# EAGLE board kicker (EAGLE 9.1.3)
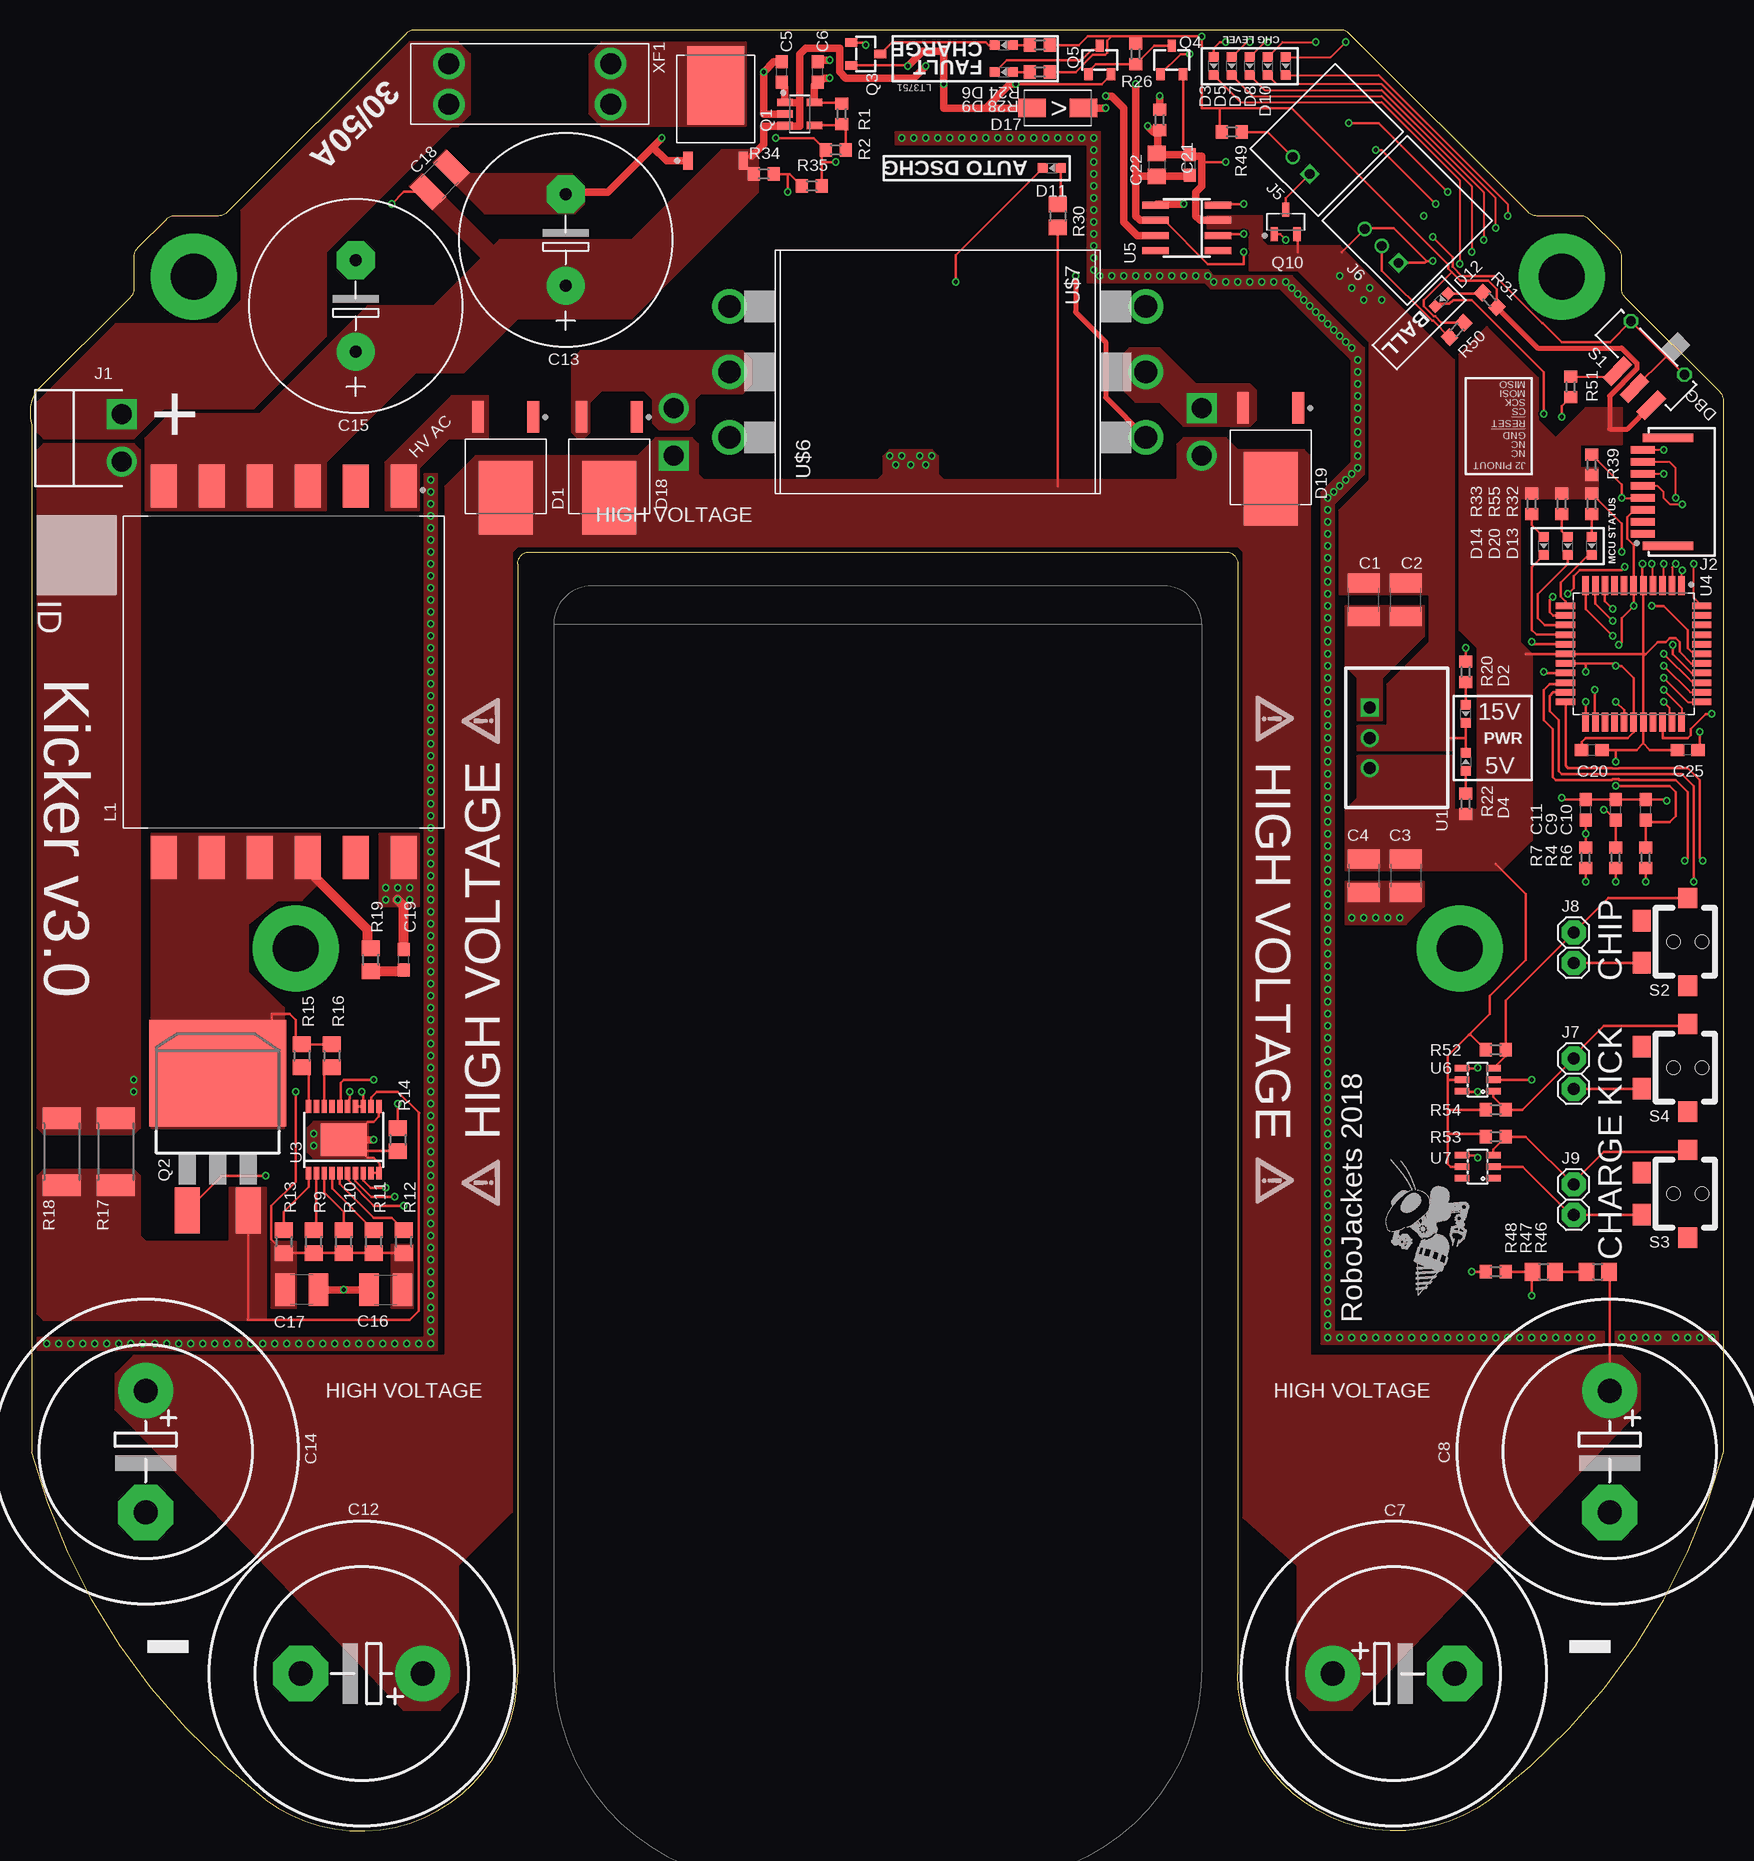
[diagram p7: board, top side]
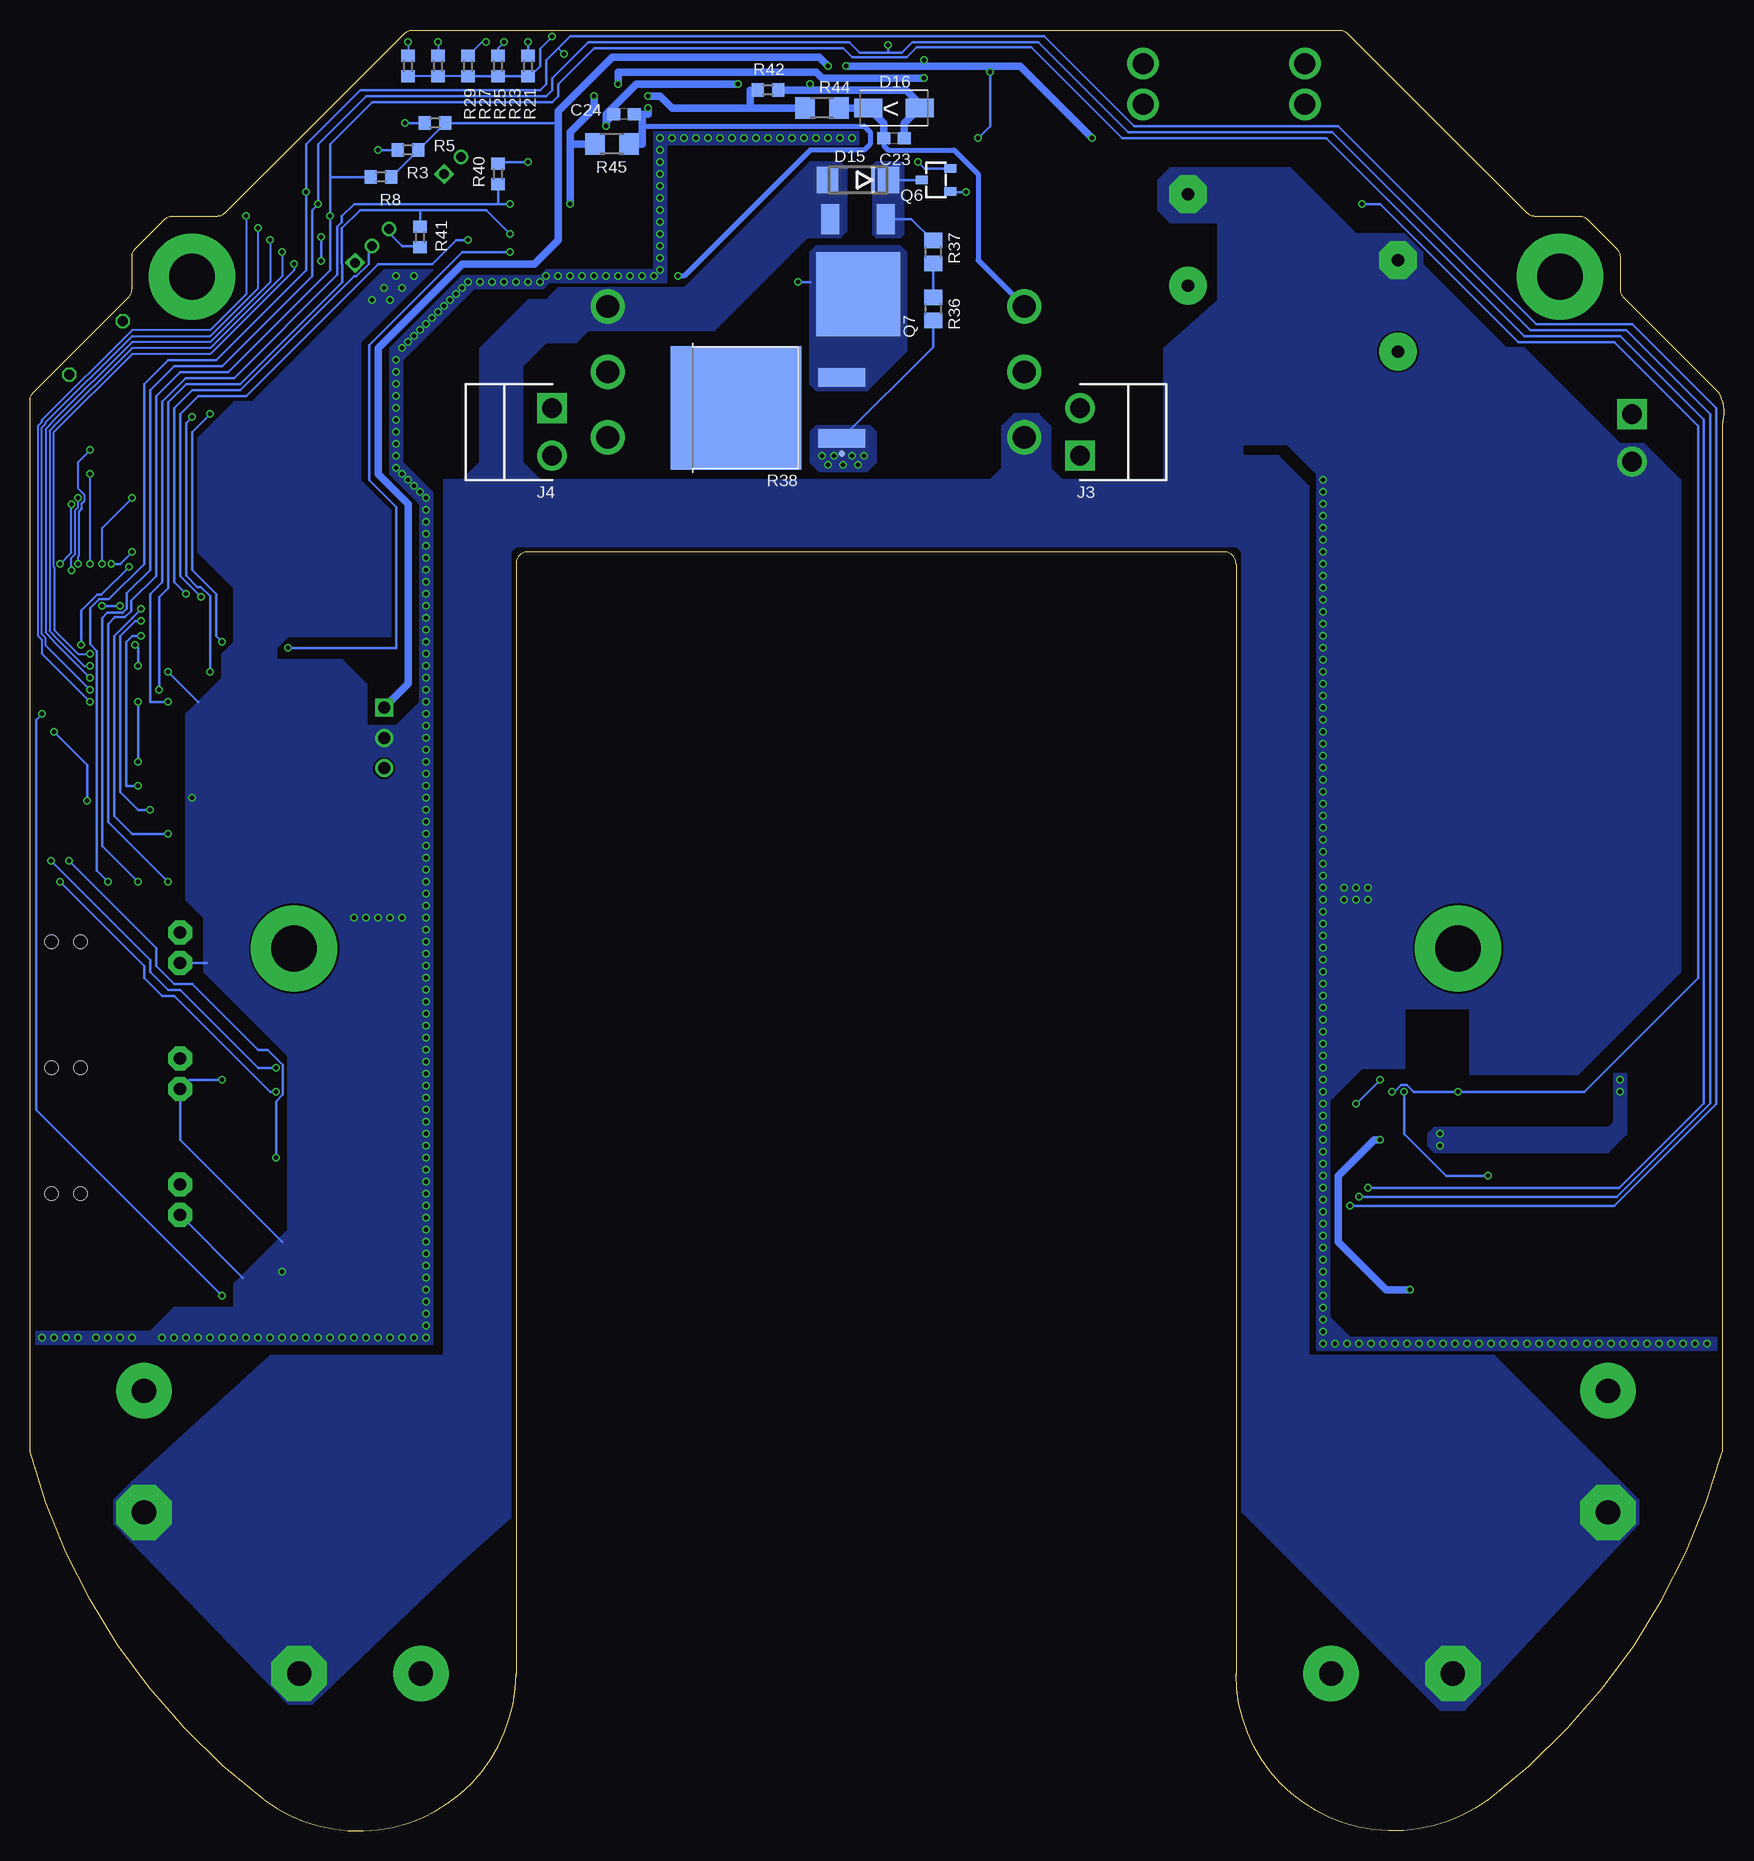
[diagram p8: board, bottom side, seen from below]

Size 141.14 x 150.12 mm. Coordinates in mm from the lower left corner, seen from the top.
Outline: 40.64,105.62 arc-90 41.64,106.62 99.64,106.62 arc-90 100.64,105.62 100.64,13.12 arc127 121.64,2.62 arc38 141.14,31.62 141.14,119.2 arc45 140.85,119.91 132.94,127.83 arc-45 132.64,128.53 132.64,131.2 arc45 132.35,131.91 129.94,134.33 arc45 129.23,134.62 125.56,134.62 arc-45 124.85,134.91 109.94,149.83 arc45 109.23,150.12 32.06,150.12 arc45 31.35,149.83 16.44,134.91 arc-45 15.73,134.62 12.06,134.62 arc45 11.35,134.33 8.94,131.91 arc45 8.64,131.2 8.64,128.53 arc-45 8.35,127.83 0.44,119.91 arc45 0.14,117.2 0.14,31.62 arc38 19.64,2.62 arc127 40.64,13.12 40.64,105.62
Copper layers (1*16): Top 0.018mm / dielectric 1.55mm / Bottom 0.018mm
Design rules "eC_2Layer_PClass6_BaseCopperO18_eCDefault": minimum track width 0.15mm, minimum drill 0.35mm, track to track 0.15mm, track to pad 0.15mm, pad to pad 0.15mm, via to via 0.15mm, smd to smd 0mil, copper to edge 0.25mm, drill to drill 0.35mm, minimum pad ring 0.175mm, minimum via ring 0.125mm, stop-mask expansion 0mil, vias tented up to drill 0.45mm, thermal gap 0.2mm
vRestrict: area 18.4,69.8 to 25.9,77.3; area 115.4,69.8 to 122.9,77.3; area 9.9,125.8 to 17.4,133.3; area 123.9,125.8 to 131.4,133.3

## Footprints (pad centres in the part's own frame; a part is rotated, then mirrored left to right if it is on the bottom)
C1210 = smd 1.6 x 2.7: 1 -1.4,0; 2 1.4,0
C0603 = smd 1.1 x 1: 1 -0.85,0; 2 0.85,0
EB25D = drill 2.007 pad 4.597: + -5.08,0 | drill 2.007 pad 4.597 octagon: - 5.08,0
E7,5-18 = drill 1.016 pad 3.15: + -3.81,0 | drill 1.016 pad 3.15 octagon: - 3.81,0
C0805 = smd 1.3 x 1.5: 1 -0.95,0; 2 0.95,0
TO460P990X239-3 = smd 2.634 x 0.974: 1 -4.241,2.3; 2 -4.241,-2.3 | smd 6.101 x 4.492: 3 2.507,0
CHIP-LED0603 = smd 0.8 x 0.8: A 0,-0.75; C 0,0.75
DO214AA = smd 1.8 x 2.2: A 2.55,0; C -2.55,0
RESM5226X262 = smd 2.316 x 1.565: 1 -2.141,0; 2 2.141,0
B2PS-CENTERED = drill 1.65 square: 1 -1.98,0 | drill 1.65: 2 1.98,0
HFW8R-1ST = smd 0.6 x 2: 1 -3.5,3.25; 2 -2.5,3.25; 3 -1.5,3.25; 4 -0.5,3.25; 5 0.5,3.25; 6 1.5,3.25; 7 2.5,3.25; 8 3.5,3.25 | smd 0.7 x 4.2: LEG1 -4.5,1.15; LEG2 4.5,1.15
2MM-2-H = drill 0.8 square: 1 0,0 | drill 0.8: 2 2,0
2MM-3-H = drill 0.8 square: 1 -2,0 | drill 0.8: 2 0,0; 3 2,0
1X2 = drill 1.016 pad 2 octagon: 1 -1.27,0; 2 1.27,0
SOP400P3370X1400-12 = smd 3.562 x 2.172: 1 -15.475,10; 2 -15.475,6; 3 -15.475,2; 4 -15.475,-2; 5 -15.475,-6; 6 -15.475,-10; 7 15.475,-10; 8 15.475,-6; 9 15.475,-2; 10 15.475,2; 11 15.475,6; 12 15.475,10
TO460P950X150-3 = smd 1.512 x 0.772: 1 -4.4,2.3; 2 -4.4,-2.3 | smd 6.542 x 4.772: 3 1.885,0
D2PAK = smd 2.083 x 3.81: 1 -2.54,-8.89; 3 2.54,-8.89 | smd 11.43 x 8.89: 2 0,2.54
SOT-23-3 = smd 0.7 x 1: 1 -0.95,-1.2; 2 0.95,-1.2; 3 0,1.2
DPAK = smd 1.5 x 2.5: 1 -2.3,-6.25; 3 2.3,-6.25 | smd 7 x 7: FIN 0,0
SOT95P240X110-3 = smd 1.18 x 0.609: 1 -1.024,0.95; 2 -1.024,-0.95; 3 1.024,0
R0603 = smd 1 x 1.1: 1 -0.85,0; 2 0.85,0
R0805 = smd 1.3 x 1.5: 1 -0.95,0; 2 0.95,0
R2512 = smd 1.8 x 3.2: 1 -2.8,0; 2 2.8,0
TO508P1539X450-3 = smd 3.912 x 1.572: 1 -6.145,2.54; 2 -6.145,-2.54 | smd 10.892 x 10.272: 3 2.655,0
R1206 = smd 1.6 x 1.803: 1 -1.422,0; 2 1.422,0
CSS-121XB = smd 1 x 2.5: 1 -3,3.75; 2 -1,3.75; 3 1,3.75 | drill 0.8 pad 1.2 octagon: LEG1 -3.15,0; LEG4 3.15,0
HDP001R = smd 1.8 x 1.5: A -1.75,-3.85; B 1.75,-3.85 | smd 1.7 x 1.6: C -3.65,0; D 3.65,0 | hole 1.1: 0,1.2; 0,-1.2
R-78E = drill 1 square: 1 -2.54,0 | drill 1: 2 0,0; 3 2.54,0
SOT95P280X145-5 = smd 1.259 x 0.609: 1 -1.228,0.95; 2 -1.228,0; 3 -1.228,-0.95; 4 1.228,-0.95; 5 1.228,0.95
TSSOP-20_EP = smd 1.05 x 0.45: 1 -2.775,2.925; 2 -2.775,2.275; 3 -2.775,1.625; 4 -2.775,0.975; 5 -2.775,0.325; 6 -2.775,-0.325; 7 -2.775,-0.975; 8 -2.775,-1.625; 9 -2.775,-2.275; 10 -2.775,-2.925; 11 2.775,-2.925; 12 2.775,-2.275; 13 2.775,-1.625; 14 2.775,-0.975; 15 2.775,-0.325; 16 2.775,0.325; 17 2.775,0.975; 18 2.775,1.625; 19 2.775,2.275; 20 2.775,2.925 | smd 2.74 x 3.86: PAD 0,0
QFP80P1200X1200X120-44 = smd 1.6 x 0.547: 1 -5.681,4; 2 -5.681,3.2; 3 -5.681,2.4; 4 -5.681,1.6; 5 -5.681,0.8; 6 -5.681,0; 7 -5.681,-0.8; 8 -5.681,-1.6; 9 -5.681,-2.4; 10 -5.681,-3.2; 11 -5.681,-4; 23 5.681,-4; 24 5.681,-3.2; 25 5.681,-2.4; 26 5.681,-1.6; 27 5.681,-0.8; 28 5.681,0; 29 5.681,0.8; 30 5.681,1.6; 31 5.681,2.4; 32 5.681,3.2; 33 5.681,4 | smd 0.547 x 1.6: 12 -4,-5.681; 13 -3.2,-5.681; 14 -2.4,-5.681; 15 -1.6,-5.681; 16 -0.8,-5.681; 17 0,-5.681; 18 0.8,-5.681; 19 1.6,-5.681; 20 2.4,-5.681; 21 3.2,-5.681; 22 4,-5.681; 34 4,5.681; 35 3.2,5.681; 36 2.4,5.681; 37 1.6,5.681; 38 0.8,5.681; 39 0,5.681; 40 -0.8,5.681; 41 -1.6,5.681; 42 -2.4,5.681; 43 -3.2,5.681; 44 -4,5.681
SOIC-8 = smd 0.6 x 2.2: 1 -1.905,-2.6; 2 -0.635,-2.6; 3 0.635,-2.6; 4 1.905,-2.6; 5 1.905,2.6; 6 0.635,2.6; 7 -0.635,2.6; 8 -1.905,2.6
SOT-23-6 = smd 0.55 x 1.2: 1 -0.95,-1.3; 2 0,-1.3; 3 0.95,-1.3; 4 0.95,1.3; 5 0,1.3; 6 -0.95,1.3
TO264 = drill 1.905: C_BOT 0,-6.35; E_BOT 5.461,-6.35; G_BOT -5.461,-6.35
3557-2 = drill 1.75: 1 -6.735,1.7; 2 -6.735,-1.7; 3 6.735,-1.7; 4 6.735,1.7

## Placement (x,y rotation side)
C1  4.7uf 35V  [C1210]  111.14,102.62 90 top
C2  4.7uf 35V  [C1210]  114.64,102.62 90 top
C3  4.7uf 16V  [C1210]  114.64,79.62 270 top
C4  4.7uf 16V  [C1210]  111.14,79.62 270 top
C5  1uF  [C0603]  62.64,146.62 90 top
C6  2.2uF  [C0603]  65.64,146.62 90 top
C7  1000uF  [EB25D]  113.64,13.12 0 top
C8  1000uF  [EB25D]  131.64,31.62 270 top
C9  1uF  [C0603]  132.14,85.12 90 top
C10  1uF  [C0603]  134.64,85.12 90 top
C11  1uF  [C0603]  129.64,85.12 90 top
C12  1000uF  [EB25D]  27.64,13.12 180 top
C13  560uF  [E7,5-18]  44.64,132.62 90 top
C14  1000uF  [EB25D]  9.64,31.62 270 top
C15  560uF  [E7,5-18]  27.14,127.12 90 top
C16  10uF (X7R)  [C1210]  29.64,45.12 0 top
C17  10uF (X7R)  [C1210]  22.64,45.12 180 top
C18  10uF (X7R)  [C1210]  34.14,137.62 225 top
C19  220pF 100V  [C0603]  31.14,72.62 90 top
C20  0.1uF  [C0603]  130.14,90.12 0 top
C21  0.1uF 35V  [C0603]  96.64,138.87 270 top
C22  22uF 35V  [C0805]  93.89,138.87 270 top
C23  0.1uF 50V  [C0603]  69.14,141.12 0 bottom
C24  0.1uF 50V  [C0603]  91.64,143.12 180 bottom
C25  0.1uF  [C0603]  138.14,90.12 180 top
D1  VS-5EWH06FN-M3D-PAK_TO252AA  [TO460P990X239-3]  39.64,113.62 270 top
D2  GREEN  [CHIP-LED0603]  119.64,93.12 180 top
D3  GREEN  [CHIP-LED0603]  98.64,147.12 180 top
D4  GREEN  [CHIP-LED0603]  119.64,89.12 0 top
D5  GREEN  [CHIP-LED0603]  100.14,147.12 180 top
D6  GREEN  [CHIP-LED0603]  81.14,148.87 90 top
D7  YELLOW  [CHIP-LED0603]  101.64,147.12 180 top
D8  RED  [CHIP-LED0603]  103.14,147.12 180 top
D9  RED  [CHIP-LED0603]  81.14,146.62 90 top
D10  RED  [CHIP-LED0603]  104.64,147.12 180 top
D11  YELLOW  [CHIP-LED0603]  85.14,138.62 90 top
D12  BLUE  [CHIP-LED0603]  117.64,127.62 135 top
D13  GREEN  [CHIP-LED0603]  130.14,107.12 180 top
D14  RED  [CHIP-LED0603]  126.14,107.12 180 top
D15  3SMBJ5929B-TP  [DO214AA]  72.14,137.62 180 bottom
D16  SMAJ20ADO-214AC  [RESM5226X262]  69.14,143.62 180 bottom
D17  SMAJ20ADO-214AC  [RESM5226X262]  85.64,143.62 0 top
D18  VS-5EWH06FN-M3D-PAK_TO252AA  [TO460P990X239-3]  48.27,113.62 270 top
D19  VS-5EWH06FN-M3D-PAK_TO252AA  [TO460P990X239-3]  103.39,114.37 270 top
D20  YELLOW  [CHIP-LED0603]  128.14,107.12 180 top
J1  B2PS-VH(LF)(SN)  [B2PS-CENTERED]  7.64,116.12 270 top
J2  HFW8R-1ST  [HFW8R-1ST]  137.64,111.62 90 top
J3  B2PS-VH(LF)(SN)  [B2PS-CENTERED]  53.64,116.62 90 bottom
J4  B2PS-VH(LF)(SN)  [B2PS-CENTERED]  97.64,116.62 270 bottom
J5  2-PIN_2MM-H  [2MM-2-H]  106.64,138.12 135 top
J6  3-PIN_2MM-H  [2MM-3-H]  112.64,132.12 135 top
J7  !BTN_KCK_PRE_EXT  [1X2]  128.64,63.12 270 top
J8  !BTN_CHP_PRE_EXT  [1X2]  128.64,73.62 270 top
J9  !BTN_CHG_PRE_EXT  [1X2]  128.64,52.62 270 top
L1  GA34XX-BLBL  [SOP400P3370X1400-12]  21.14,96.62 270 top
Q1  ATP302ATPAK  [TO460P950X150-3]  57.14,143.62 90 top
Q2  IRFS4227  [D2PAK]  15.64,60.62 0 top
Q3  BSS127  [SOT-23-3]  69.64,148.12 270 top
Q4  BSS127  [SOT-23-3]  95.14,147.62 0 top
Q5  BSS127  [SOT-23-3]  89.14,147.62 0 top
Q6  BSS127  [SOT-23-3]  65.64,137.62 90 bottom
Q7  AOD1N60  [DPAK]  72.14,128.12 180 bottom
Q10  BSS806NSOT-23-3  [SOT95P240X110-3]  104.64,134.12 90 top
R1  110k  [R0603]  67.64,143.12 90 top
R2  10k  [R0603]  67.14,140.12 0 top
R3  100k  [R0603]  109.64,140.12 0 bottom
R4  160  [R0603]  132.14,81.12 270 top
R5  100k  [R0603]  107.39,142.37 0 bottom
R6  160  [R0603]  134.64,81.12 270 top
R7  160  [R0603]  129.64,81.12 270 top
R8  100k  [R0603]  111.89,137.87 0 bottom
R9  294k 1%  [R0805]  23.64,49.12 90 top
R10  412k 1%  [R0805]  26.14,49.12 90 top
R11  294k 1%  [R0805]  28.64,49.12 90 top
R12  412k 1%  [R0805]  31.14,49.12 90 top
R13  40.2k 1%  [R0805]  21.14,49.12 270 top
R14  1.62k 1%  [R0805]  30.64,57.62 270 top
R15  18.2k 1%  [R0805]  22.64,64.62 270 top
R16  40.2k 1%  [R0805]  25.14,64.62 270 top
R17  7.5m 1%  [R2512]  7.14,56.62 270 top
R18  7.5m 1%  [R2512]  2.64,56.62 270 top
R19  22  [R0805]  28.39,72.62 90 top
R20  1k  [R0603]  119.64,96.62 90 top
R21  162  [R0603]  99.64,147.12 270 bottom
R22  162  [R0603]  119.64,85.62 270 top
R23  162  [R0603]  102.14,147.12 270 bottom
R24  162  [R0603]  84.14,148.87 0 top
R25  261  [R0603]  104.64,147.12 270 bottom
R26  1k  [R0603]  92.14,148.12 90 top
R27  261  [R0603]  107.14,147.12 270 bottom
R28  261  [R0603]  84.14,146.62 0 top
R29  261  [R0603]  109.64,147.12 270 bottom
R30  ERJ-P06J274V  [R0805]  85.64,134.62 270 top
R31  60  [R0603]  121.64,127.62 315 top
R32  162  [R0603]  130.14,110.62 90 top
R33  261  [R0603]  125.14,110.62 90 top
R34  270k  [R0603]  61.14,138.12 180 top
R35  100k  [R0603]  65.14,137.12 180 top
R36  ERJ-6GEYJ515V  [R0805]  65.89,126.87 270 bottom
R37  ERJ-6GEYJ515V  [R0805]  65.89,131.62 270 bottom
R38  1.5k 35W  [TO508P1539X450-3]  79.64,118.62 180 bottom
R39  10k  [R0603]  130.14,113.87 270 top
R40  10k  [R0603]  102.14,138.12 270 bottom
R41  10k  [R0603]  108.64,132.87 90 bottom
R42  10k  [R0603]  79.64,145.12 180 bottom
R43  10k  [R0603]  94.14,142.62 90 top
R44  160  [R1206]  75.14,143.62 0 bottom
R45  160  [R1206]  92.64,140.62 0 bottom
R46  ERJ-6GEYJ515V  [R0805]  130.64,46.62 0 top
R47  ERJ-6GEYJ515V  [R0805]  126.14,46.62 0 top
R48  RC0603FR-07205KL  [R0603]  122.14,46.62 0 top
R49  50  [R0603]  100.14,141.62 0 top
R50  10k  [R0603]  118.89,125.12 45 top
R51  10k  [R0603]  128.39,120.37 270 top
R52  10k  [R0603]  122.14,65.12 180 top
R53  10k  [R0603]  122.14,57.87 180 top
R54  10k  [R0603]  122.14,60.12 180 top
R55  60  [R0603]  127.64,110.62 90 top
S1  CSS-121XB  [CSS-121XB]  135.64,123.62 135 top
S2  HDP001R  [HDP001R]  138.14,74.12 270 top
S3  HDP001R  [HDP001R]  138.14,53.12 270 top
S4  HDP001R  [HDP001R]  138.14,63.62 270 top
U1  R-78E5.0-0.5  [R-78E]  111.64,91.12 270 top
U2  15V  [SOT95P280X145-5]  64.14,143.12 0 top
U3  LT3751FE  [TSSOP-20_EP]  26.14,57.62 90 top
U4  AT32ATQFP44  [QFP80P1200X1200X120-44]  133.64,98.12 270 top
U5  IX4427N  [SOIC-8]  96.39,133.62 90 top
U6  MAX6817  [SOT-23-6]  120.64,62.62 90 top
U7  MAX6817  [SOT-23-6]  120.64,55.37 90 top
U$1  [WARNING2]  39.14,52.12 90 top
U$2  [WARNING2]  39.14,90.62 90 top
U$3  [WARNING2]  102.14,94.62 270 top
U$4  [WARNING2]  102.14,56.12 270 top
U$5  [ROBOBUZZ_0.6X]  115.64,44.62 0 top
U$6  IXGK400N30A3  [TO264]  86.64,121.62 90 top
U$7  IXGK400N30A3  [TO264]  64.64,121.62 270 top
XF1  30A  [3557-2]  41.64,145.62 0 top

## Tracks (layer width: path | path; a pad name or v marks a point on that pad's centre or on a via)
!BTN_CHG  (via drill 0.35)
  Top 0.2: U4.20 127.86,95.62 126.64,95.62 126.14,95.12 126.14,92.62 126.89,91.87 126.89,87.87 127.14,87.62 131.83,87.62 131.9,87.69 132.38,87.69 132.46,87.62 137.14,87.62 138.14,86.62 138.14,81.12 v137.89,80.87 | U7.4 120.44,56.32 v120.64,56.12
  Bottom 0.2: v120.64,56.12 120.64,60.81 120.07,61.38 120.07,63.86 121.33,65.12 122.14,65.12 127.64,70.62 129.14,70.62 130.64,72.12 130.64,73.62 v137.89,80.87
!BTN_CHG_PRE
  Top 0.2: S3.C 137.99,56.62 131.14,56.62 128.64,54.12 J9.1 124.66,57.87 R53.1 121.94,56.82 U7.3
!BTN_CHP  (via drill 0.35)
  Top 0.2: U4.22 127.96,88.8 128.14,88.62 131.83,88.62 131.9,88.54 132.38,88.54 132.46,88.62 138.14,88.62 139.14,87.62 139.14,81.12 v139.39,80.87 | U6.4 120.59,63.57 v120.64,63.62
  Bottom 0.2: v120.64,63.62 122.14,63.62 128.64,70.12 129.64,70.12 131.14,71.62 131.14,72.62 v139.39,80.87
!BTN_CHP_PRE
  Top 0.2: S2.C 131.52,77.77 J8.1 122.99,69.24 122.99,66.24 122.99,65.62 R52.1 122.99,64.62 U6.3
!BTN_KCK  (via drill 0.35)
  Top 0.2: U4.21 126.94,94.92 126.64,94.62 126.64,93.37 127.39,92.62 127.39,88.37 127.64,88.12 137.64,88.12 138.64,87.12 v138.64,79.12 | U6.6 119.39,61.62 v120.64,61.62
  Bottom 0.2: v120.64,61.62 121.14,61.62 129.14,69.62 130.14,69.62 131.64,71.12 131.64,72.12 v138.64,79.12
!BTN_KCK_PRE
  Top 0.2: S4.C 137.99,67.12 131.14,67.12 128.64,64.62 J7.1 124.37,60.12 R54.1 121.94,61.17 U6.1
!DONE!  (via drill 0.35)
  Top 0.2: R4.1 C9.1 131.14,85.27 v131.14,85.12 | v131.89,100.87 130.44,102.32 U4.10
  Bottom 0.2: v131.14,85.12 132.14,85.12 133.64,86.62 133.64,99.59 132.36,100.87 v131.89,100.87
!DONE_LPF  (via drill 0.35)
  Top 0.2: v30.39,52.87 28.42,52.87 27.12,54.17 U3.7 | v117.14,135.62 112.64,140.12 v112.14,140.12 | R4.2 v132.14,79.12 | 68.49,149.12 Q3.1 69.44,149.07 v69.64,148.87
  Bottom 0.2: v30.39,52.87 8.92,52.87 1.14,60.65 1.14,118.12 8.14,125.12 16.14,125.12 32.64,141.62 49.64,141.62 57.14,149.12 67.64,149.12 68.52,148.24 69.64,148.24 | v112.14,140.12 R3.1 | v132.14,79.12 135.14,82.12 135.14,101.12 134.72,101.54 133.4,101.54 133.07,101.88 133.07,103.19 131.14,105.12 131.14,120.12 129.14,122.12 125.14,122.12 117.64,129.62 117.64,135.12 v117.14,135.62 117.14,140.62 113.14,144.62 98.14,144.62 97.64,145.12 97.64,146.12 94.64,149.12 72.89,149.12 72.02,148.24 69.64,148.24 | v69.64,148.87 69.64,148.24
!FAULT!  (via drill 0.35)
  Top 0.2: R6.1 134.64,84.12 C10.1 134.79,84.12 136.64,84.12 137.14,84.62 137.14,86.62 136.64,87.12 v132.14,87.12 | v131.89,99.62 129.64,101.87 U4.11
  Bottom 0.2: v132.14,87.12 133.14,87.12 133.14,99.12 132.64,99.62 v131.89,99.62
!FAULT_LPF  (via drill 0.35)
  Top 0.2: U3.6 26.47,54.29 28.64,52.12 v31.14,52.12 | Q4.1 95.89,148.12 v96.64,148.12 | v118.14,136.62 112.39,142.37 v109.89,142.37 | R6.2 v134.64,79.12
  Bottom 0.2: v31.14,52.12 9.14,52.12 0.64,60.62 0.64,118.62 7.64,125.62 15.64,125.62 32.14,142.12 49.14,142.12 56.64,149.62 96.14,149.62 97.14,148.62 | 97.14,148.62 98.14,147.62 98.14,145.62 98.64,145.12 113.64,145.12 118.14,140.62 v118.14,136.62 118.14,130.12 125.64,122.62 129.64,122.62 131.64,120.62 131.64,105.62 134.57,102.69 135.38,102.69 136.14,101.93 136.14,98.93 135.57,98.36 135.57,80.04 v134.64,79.12 | v96.64,148.12 97.14,148.62 | R5.1 v109.89,142.37
!KICKER_SELECT  (via drill 0.35)
  Top 0.15: U4.44 138.64,102.8 138.64,105.12 v138.64,105.62 | v137.69,110.57 137.37,110.57 136.69,110.57 136.14,111.12 136.14,111.62 135.64,112.12 J2.5
  Bottom 0.15: v138.64,105.62 137.69,106.57 v137.69,110.57
!RESET  (via drill 0.35)
  Top 0.15: U4.4 135.24,105.52 v135.14,105.62 | v132.64,111.12 J2.4
  Top 0.2: R39.1 132.64,112.22 v132.64,111.12
  Bottom 0.15: v135.14,105.62 135.14,108.62 v132.64,111.12
+5V  (via drill 0.35)
  Top 0.2: R28.2 87.14,146.62 88.57,148.04 89.61,148.04 89.77,148.2 89.77,149.24 90.14,149.62 | 90.14,149.62 88.14,149.62 87.39,148.87 R24.2 | 90.14,149.62 92.14,149.62 | 92.14,149.62 97.64,149.62 v97.64,149.57 97.64,143.62 99.14,143.62 | R26.2 92.14,149.62 | 99.14,143.62 105.14,143.62 118.19,130.57 118.19,130.22 118.47,129.95 | R31.2 122.24,128.52 121.52,129.24 119.17,129.24 118.47,129.95 | 118.47,129.95 116.14,127.62 116.14,127.1 117,126.25 117.09,126.25 117.62,125.72 R50.2 | 132.14,90.12 133.89,90.12 134.44,90.67 | 134.44,90.67 U4.29 134.44,97.92 | 134.44,97.92 134.64,98.12 | 134.64,98.12 135.64,99.12 136.33,99.12 136.65,99.44 137.13,99.44 137.47,99.11 137.47,98.29 138.44,97.32 U4.38 | 134.64,98.12 U4.17 124.64,98.12 | 134.44,97.92 U4.5 134.37,103.87 v134.37,105.62 | U4.27 132.84,93.42 v132.14,94.12 | v132.14,89.12 132.14,90.12 | R32.2 132.64,108.97 v132.64,106.62 | U7.5 118.39,55.37 118.14,55.62 118.14,58.12 | 118.14,58.12 118.14,60.12 | 118.14,60.12 118.14,62.62 | 118.14,62.62 118.14,64.62 119.89,66.37 | R53.2 121.04,58.12 118.14,58.12 | R54.2 118.14,60.12 | U6.5 118.14,62.62 | 119.89,66.37 121.64,68.12 121.64,69.62 124.64,72.62 124.64,78.12 122.14,80.62 | R52.2 120.04,66.37 119.89,66.37 | R49.1 99.14,141.77 99.14,143.62 | 134.44,90.67 134.99,90.12 C25.2 | 132.14,90.12 C20.2
  Top 0.406: S1.1 133.14,116.87 131.64,116.87 131.64,119.62 133.9,121.88 133.9,122.36 132.64,123.62 125.64,123.62 R31.2
  Bottom 0.15: R25.2 R27.2 R29.2
  Bottom 0.2: v97.64,149.57 98.64,148.57 98.64,147.12 99.49,146.27 R21.2 R23.2 R25.2 | v132.14,94.12 v132.14,89.12 | v132.64,106.62 133.64,105.62 v134.37,105.62
  pour Top (no thermals): 110.64,89.62 118.64,89.62 118.64,80.12 109.64,80.12 109.64,85.12 110.64,86.12
  pour Top (no thermals): 119.14,100.12 119.14,123.12 121.39,125.37 125.64,121.12 125.64,117.62 127.14,116.12 129.64,118.62 132.64,118.62 132.64,115.62 129.14,115.62 129.14,113.62 130.64,113.62 130.64,111.12 124.14,111.12 124.14,103.62 124.14,99.12 125.14,98.12 125.14,82.62 122.64,80.12 117.64,80.12 117.64,85.12 120.64,85.12 120.64,98.62
+15.0V  (via drill 0.35)
  Top 0.2: U5.6 94.51,134.25 98.14,130.62 101.14,130.62 v101.14,131.62 | R20.2 v119.64,98.62 | R1.2 67.54,144.07 U2.5 | C6.1 65.79,145.77
  Top 0.61: C21.2 96.54,137.92 C22.2 92.34,137.92 92.14,138.12 | U5.6 92.51,134.25 92.14,134.62 92.14,138.12 | 92.14,138.12 v92.14,145.62 | 65.79,145.77 66.14,146.12 v66.64,146.12 | U2.5 65.37,145.5 C6.1
  Bottom 0.2: v101.14,131.62 105.14,131.62 112.89,123.87 112.89,112.62 110.64,110.37 110.64,98.62 v119.64,98.62
  Bottom 0.61: v92.14,145.62 92.14,146.62 75.64,146.62 75.14,146.12 v66.64,146.12
BALL_SENSE  (via drill 0.35)
  Top 0.2: D12.C 117.33,127.31 118.29,127.31 118.6,127.62 120.14,127.62 126.14,121.62 v126.14,118.12 | U4.16 125.34,98.92 v125.14,99.12
  Bottom 0.2: v126.14,118.12 127.64,116.62 127.64,105.12 125.64,103.12 125.64,99.62 v125.14,99.12
BB_RX  (via drill 0.35)
  Top 0.2: R50.1 116.94,125.87 116.84,125.87 112.64,130.07 J6.2 | v128.14,103.12 128.64,103.62 128.64,104.62 129.14,105.12 132.64,105.12 v132.89,105.37 | v136.89,98.87 136.89,98.12 138.49,96.52 U4.37
  Bottom 0.2: J6.2 112.93,131.83 112.93,130.59 113.94,129.58 114.14,129.58 123.6,120.12 127.64,120.12 129.14,118.62 129.14,104.12 v128.14,103.12 | v136.89,98.87 136.89,101.71 135.54,103.07 135.19,103.07 v132.89,105.37
BB_TX  (via drill 0.35)
  Top 0.2: v126.89,102.87 126.64,102.62 126.64,101.62 126.94,101.32 U4.13 | Q10.1 104.17,133.09 v104.64,132.62
  Bottom 0.2: v104.64,132.62 105.64,132.62 107.64,130.62 112.14,130.62 123.14,119.62 127.14,119.62 128.64,118.12 128.64,104.62 v126.89,102.87
CHARGE  (via drill 0.35)
  Top 0.2: C11.1 v129.64,83.12 R7.1 | U4.9 131.24,102.52 v131.89,101.87
  Bottom 0.2: v129.64,83.12 132.64,83.12 134.14,84.62 134.14,99.62 132.64,101.12 v131.89,101.87
CHARGE_LPF  (via drill 0.35)
  Top 0.2: U3.8 27.77,54.24 28.39,53.62 v29.64,53.62 | R7.2 v129.64,79.12
  Bottom 0.2: v29.64,53.62 8.7,53.62 1.67,60.65 1.67,117.65 8.64,124.62 16.64,124.62 33.14,141.12 50.14,141.12 57.72,148.7 67.25,148.7 68.08,147.87 72.64,147.87 73.39,148.62 94.14,148.62 97.14,145.62 97.14,144.62 97.64,144.12 112.64,144.12 116.14,140.62 116.14,137.87 | 116.14,137.87 v116.14,134.62 116.14,130.12 124.64,121.62 128.64,121.62 130.64,119.62 130.64,104.62 132.69,102.57 132.69,101.72 | R8.1 116.14,137.87 | v129.64,79.12 134.64,84.12 134.64,100.62 134.09,101.17 133.25,101.17 132.72,101.7 | 132.72,101.7 132.69,101.72 | 132.69,101.72 132.72,101.7
CHIP  (via drill 0.35)
  Top 0.2: U5.2 99.51,132.98 99.64,133.12 v101.14,133.12 | v130.39,95.12 130.39,92.49 U4.24
  Bottom 0.2: v101.14,133.12 103.14,135.12 108.64,135.12 | 108.64,135.12 113.64,135.12 115.18,133.58 115.18,130.59 115.14,130.55 115.14,129.12 123.64,120.62 128.14,120.62 129.64,119.12 129.64,103.62 130.39,102.87 v130.39,95.12 | R41.2 108.64,135.12
CHIP_GATE  (via drill 0.35)
  Top 0.61: U5.7 92.28,132.98 91.14,134.12 91.14,143.62 90.14,144.62 v89.64,144.62
  Bottom 0.61: R44.1 79.14,143.62 80.14,143.62 81.14,143.62 | R42.2 81.14,145.12 81.14,143.62 | v89.64,144.62 88.64,144.62 87.64,143.62 81.14,143.62
CHIPPER
  pour Top (no thermals): 45.14,116.62 45.64,116.12 46.14,116.12 46.64,116.62 46.64,119.12 47.14,119.62 47.64,120.12 51.14,120.12 51.89,119.37 51.89,117.37 52.39,116.87 54.39,116.87 54.89,116.87 55.39,117.37 55.39,119.37 55.89,119.87 58.89,119.87 59.39,119.87 60.14,120.62 60.14,122.62 59.39,123.37 45.89,123.37 45.14,122.62
DISCHARGE_DRAIN  (via drill 0.35)
  Top 0.2: D11.C 77.14,131.37 v77.14,129.12
  Bottom 0.2: v77.14,129.12 76.14,129.12
  pour Bottom (no thermals): 68.14,131.62 68.64,132.12 75.64,132.12 76.14,131.62 76.14,120.62 75.64,120.12 71.64,120.12 71.39,120.12 68.14,123.37
GND  (via drill 0.35)
  Top 0.2: U3.11 29.07,59.54 28.64,59.12 28.14,59.12 26.89,57.87 26.64,57.62 | 26.64,57.62 U3.PAD | U3.9 U3.10 29.14,54.92 29.14,55.62 28.64,56.12 28.14,56.12 27.64,56.62 | 27.64,56.62 26.64,57.62 | R14.2 27.69,56.67 27.64,56.62 | Q5.2 89.29,145.62 v82.14,145.62 | Q4.2 96.09,140.27 C21.1 | v99.64,139.12 97.64,139.12 | v116.89,132.87 118.57,131.19 118.57,130.38 119.33,129.62 122.1,129.62 126.04,125.68 126.08,125.68 127.64,124.12 131.69,124.12 S1.LEG4 136.39,122.87 | S3.B 134.27,51.35 J9.2 128.41,51.35 124.39,55.37 U7.2 | S4.B 128.66,61.87 J7.2 | S2.B 134.27,72.35 J8.2 | 136.39,122.87 S1.LEG1 | S1.2 136.31,122.87 136.39,122.87 | D4.C 119.64,91.12 | 119.64,91.12 D2.C | 119.64,91.12 118.14,91.12 | v116.89,130.87 116.39,130.87 | 116.39,130.87 113.64,133.62 111.31,133.62 J6.3 109.31,131.62 | J6.1 116.23,130.7 116.39,130.87 | J2.3 133.64,110.12 133.64,110.06 133.12,109.53 133.12,107.7 133.64,107.18 U4.6 v133.64,102.12 132.64,101.12 132.64,99.12 v132.39,98.87 | U4.18 129.64,97.32 | 129.64,97.32 131.94,97.32 v132.14,97.12 132.64,97.12 133.64,96.12 U4.28 133.64,91.62 133.14,91.12 129.64,91.12 129.29,90.77 C20.1 | v129.64,96.62 129.64,97.32 | U6.2 v125.14,62.62 | v127.64,86.12 127.79,85.97 C11.2 C9.2 C10.2 136.29,85.97 v136.39,85.87 | Q3.2 73.09,147.17 v73.14,147.12 | R48.1 v120.14,46.62 | Q10.2 105.64,133.04 105.64,131.62 | v62.14,141.12 65.29,141.12 R2.1 65.99,139.82 65.99,139.12 | C25.1 139.14,90.27 v139.14,91.62 | v135.14,102.12 136.14,102.12 138.14,100.12 138.14,98.62 138.64,98.12 U4.39 | R35.1 65.99,139.12 | v67.14,139.12 65.99,139.12
  Top 0.61: C17.1 v26.14,45.12 C16.1 | 26.89,57.87 27.14,57.62 v28.64,57.62 | C22.1 93.99,139.72 | 93.99,139.72 C21.1 96.74,139.62 97.64,139.62 97.64,139.12 97.64,137.12 97.14,136.62 97.14,134.62 97.51,134.25 U5.3 | C13.- 44.83,136.62 48.14,136.62 51.89,140.37 | 51.89,140.37 v52.64,141.12 | 79.64,143.62 76.14,143.62 v76.14,145.62 76.14,148.37 74.39,148.37 v73.14,147.12 | 79.64,143.62 D17.1 | R43.1 93.99,141.62 | 93.99,141.62 93.99,139.72 | v93.14,142.12 93.64,141.62 93.99,141.62 | 79.64,143.62 81.64,145.62 v82.14,145.62 | U2.2 61.14,143.12 v61.14,146.62 61.99,147.47 C5.2 | C6.2 65.79,147.62 v66.64,147.62 | Q1.1 53.04,139.22 51.89,140.37
  Top 0.813: C19.2 31.14,77.12 v30.64,77.62
  Bottom 0.2: R40.1 101.99,139.12 v99.64,139.12 | R41.1 108.74,132.12 110.14,132.12 111.23,133.2 J6.3 | v116.89,130.87 v116.89,132.87 | v133.64,102.12 v135.14,102.12 | v129.64,96.62 127.14,94.12 | J9.2 123.41,46.12 | 120.14,49.12 128.64,57.62 J7.2 127.87,62.62 v125.14,62.62 | J8.2 126.41,72.35 | v62.14,141.12 61.14,142.12 v61.14,146.62 | v132.39,98.87 132.14,98.62 v132.14,97.12 | v136.39,85.87 136.39,88.87 v139.14,91.62 | Q6.2 66.59,138.57 v67.14,139.12
  Bottom 0.61: v28.64,57.62 29.14,57.62 32.14,54.62 32.14,49.12 28.14,45.12 v26.14,45.12 | C23.2 68.29,142.33 D16.1 67,143.98 68.14,145.12 76.14,145.12 | R42.1 76.14,145.12 | C24.2 93.14,142.47 v93.14,142.12 93.14,143.12 90.64,145.62 v82.14,145.62 | 61.14,147.12 58.64,147.12 v52.64,141.12 | v61.14,146.62 61.14,147.12 | v76.14,145.62 76.14,145.12 | 61.14,147.12 66.64,147.12 | 66.64,147.12 v73.14,147.12 | v66.64,147.62 66.64,147.12
  other vias: 23.64,57.12 23.64,58.12 8.64,62.62 8.64,61.62 31.39,40.62 32.39,40.62 33.39,40.62 33.39,41.62 33.39,42.62 29.64,78.62 30.64,78.62 31.64,78.62 31.64,77.62 29.64,77.62 114.14,76.12 113.14,76.12 112.14,76.12 111.14,76.12 110.14,76.12 138.14,41.12 132.64,41.12 133.64,41.12 140.14,41.12 137.14,41.12 139.14,41.12 135.64,41.12 134.64,41.12 108.14,41.12 109.14,41.12 110.14,41.12 111.14,41.12 112.14,41.12 113.14,41.12 114.14,41.12 115.14,41.12 116.14,41.12 117.14,41.12 118.14,41.12 119.14,41.12 120.14,41.12 121.14,41.12 122.14,41.12 123.14,41.12 124.14,41.12 125.14,41.12 126.14,41.12 127.14,41.12 128.14,41.12 129.14,41.12 130.14,41.12 108.14,42.12 108.14,43.12 108.14,44.12 108.14,45.12 108.14,46.12 108.14,47.12 108.14,48.12 108.14,49.12 108.14,50.12 108.14,51.12 108.14,52.12 108.14,53.12 108.14,54.12 108.14,55.12 108.14,56.12 108.14,57.12 108.14,58.12 108.14,59.12 108.14,60.12 108.14,61.12 108.14,62.12 108.14,63.12 108.14,64.12 108.14,65.12 108.14,66.12 108.14,67.12 108.14,68.12 108.14,69.12 108.14,70.12 108.14,71.12 108.14,72.12 108.14,73.12 108.14,74.12 108.14,75.12 108.14,76.12 108.14,77.12 108.14,78.12 108.14,79.12 108.14,80.12 108.14,81.12 108.14,82.12 108.14,83.12 108.14,84.12 108.14,85.12 108.14,86.12 108.14,87.12 108.14,88.12 108.14,89.12 108.14,90.12 108.14,91.12 108.14,92.12 108.14,93.12 108.14,94.12 108.14,95.12 108.14,96.12 108.14,97.12 108.14,98.12 108.14,99.12 108.14,100.12 108.14,101.12 108.14,102.12 108.14,103.12 108.14,104.12 108.14,105.12 108.14,106.12 108.14,107.12 108.14,108.12 108.14,109.12 108.14,110.12 108.14,111.12 110.64,113.62 110.14,113.12 109.64,112.62 109.14,112.12 108.64,111.62 110.64,114.62 110.64,115.62 110.64,116.62 110.64,117.62 110.64,118.62 110.64,119.62 110.64,120.62 110.64,121.62 110.64,122.62 110.14,123.62 109.64,124.12 109.14,124.62 108.64,125.12 108.14,125.62 107.64,126.12 107.14,126.62 106.64,127.12 106.14,127.62 105.64,128.12 105.14,128.62 103.64,129.12 102.64,129.12 101.64,129.12 104.64,129.12 98.64,129.12 99.64,129.12 100.64,129.12 88.64,131.12 88.64,132.12 88.64,133.12 88.64,134.12 88.64,135.12 88.64,136.12 88.64,137.12 88.64,138.12 88.64,139.12 88.64,140.12 88.64,141.12 87.64,141.12 86.64,141.12 85.64,141.12 84.64,141.12 83.64,141.12 82.64,141.12 81.64,141.12 80.64,141.12 79.64,141.12 78.64,141.12 77.64,141.12 76.64,141.12 75.64,141.12 74.64,141.12 73.64,141.12 72.64,141.12 33.39,43.62 33.39,44.62 33.39,45.62 33.39,46.62 33.39,47.62 33.39,48.62 33.39,49.62 33.39,50.62 33.39,51.62 33.39,52.62 33.39,53.62 33.39,54.62 33.39,55.62 33.39,56.62 33.39,57.62 33.39,58.62 33.39,59.62 33.39,60.62 33.39,61.62 33.39,62.62 33.39,63.62 33.39,64.62 33.39,65.62 33.39,66.62 33.39,67.62 33.39,68.62 33.39,69.62 33.39,70.62 33.39,71.62 33.39,72.62 33.39,73.62 33.39,74.62 33.39,75.62 33.39,76.62 33.39,77.62 33.39,78.62 33.39,79.62 33.39,80.62 33.39,81.62 33.39,82.62 33.39,83.62 33.39,84.62 33.39,85.62 33.39,86.62 33.39,87.62 33.39,88.62 33.39,89.62 33.39,90.62 33.39,91.62 33.39,92.62 33.39,93.62 33.39,94.62 33.39,95.62 33.39,96.62 33.39,97.62 33.39,98.62 33.39,99.62 33.39,100.62 33.39,101.62 33.39,102.62 33.39,103.62 33.39,104.62 33.39,105.62 33.39,106.62 33.39,107.62 33.39,108.62 33.39,109.62 33.39,110.62 33.39,111.62 33.39,112.62 30.39,40.62 29.39,40.62 28.39,40.62 27.39,40.62 26.39,40.62 25.39,40.62 24.39,40.62 23.39,40.62 22.39,40.62 21.39,40.62 20.39,40.62 19.39,40.62 18.39,40.62 17.39,40.62 16.39,40.62 15.39,40.62 14.39,40.62 13.39,40.62 12.39,40.62 11.39,40.62 10.39,40.62 9.39,40.62 8.39,40.62 7.39,40.62 6.39,40.62 5.39,40.62 4.39,40.62 3.39,40.62 2.39,40.62 1.39,40.62 109.14,129.62 110.64,129.62 110.14,128.62 111.64,128.62 111.14,127.62 112.64,127.62 88.64,130.12 89.14,129.62 90.14,129.62 98.14,129.62 97.14,129.62 96.14,129.62 91.14,129.62 92.14,129.62 95.14,129.62 94.14,129.62 93.14,129.62
  pour Top (no thermals): 0.64,115.12 0.64,58.62 1.14,58.12 8.64,58.12 9.14,58.62 9.14,115.12 8.64,115.62 1.14,115.62
  pour Top: 0.64,41.12 0.64,40.12 33.89,40.12 33.89,41.12
  pour Top: 33.89,40.12 33.89,113.12 32.89,113.12 32.89,40.12
  pour Top (no thermals): 23.14,58.62 23.64,59.12 28.14,59.12 28.14,56.12 23.64,56.12 23.14,56.62 23.14,58.12
  pour Bottom: 8.14,63.12 9.14,63.12 9.14,59.12 9.64,58.62 24.14,58.62 24.64,58.12 24.64,57.12 24.14,56.62 9.64,56.62 8.14,58.12
  pour Bottom (no thermals): 3.64,71.62 3.64,112.62 6.64,115.62 8.64,115.62 16.64,123.62 18.14,123.62 25.14,130.62 25.14,131.62 26.64,133.12 30.64,133.12 36.14,138.62 46.14,138.62 47.14,137.62 47.14,135.12 46.14,134.12 42.14,134.12 42.14,127.62 46.64,123.62 46.64,112.62 55.14,112.62 56.14,113.62 56.14,117.12 57.14,118.12 59.14,118.12 60.14,117.12 60.14,113.62 61.14,112.62 65.14,112.62 71.64,112.62 96.14,112.62 98.64,112.62 100.14,114.12 100.14,115.62 100.14,122.12 99.64,122.62 98.14,124.12 95.64,124.12 94.64,125.12 84.14,125.12 76.39,132.87 73.64,132.87 73.14,133.37 73.14,138.62 73.64,139.12 76.14,139.12 86.64,128.62 87.14,128.62 92.14,128.62 97.14,128.62 98.14,127.62 99.64,127.62 103.64,123.62 103.64,114.12 104.14,113.62 105.14,112.62 106.64,112.62 106.64,111.12 106.64,39.62 121.14,39.62 132.64,29.12 134.14,27.62 134.14,25.62 119.64,10.62 117.64,10.62 105.64,22.12 101.14,26.12 101.14,106.62 100.64,107.12 40.64,107.12 40.14,106.62 40.14,26.62 23.64,10.12 21.64,10.12 7.14,25.62 7.14,27.62 19.14,39.62 34.64,39.62 34.64,112.12 37.14,114.62 40.14,114.62 40.14,115.62 36.39,115.62 33.89,113.12 33.89,40.12 0.64,40.12 0.64,41.12 31.14,41.12 32.89,42.87 32.89,60.87 30.14,63.62 26.64,63.62 26.64,68.62 21.14,68.62 21.14,63.12 12.14,63.12
  pour Top (no thermals): 34.64,140.12 36.64,138.12 45.14,138.12 46.14,137.12 46.14,135.62 45.39,134.87 37.89,134.87 33.64,139.12
  pour Top (no thermals): 29.14,83.12 29.14,77.12 32.39,77.12 32.39,83.12
  pour Top (no thermals): 111.64,124.12 111.64,112.62 109.14,110.12 109.14,103.12 116.64,103.12 116.64,99.12 113.14,95.62 113.14,92.12 110.64,92.12 110.64,90.12 118.64,90.12 118.64,122.62 109.14,132.12 103.14,132.12 102.64,132.62 102.64,134.62 98.14,134.62 98.14,133.62 101.64,133.62 101.64,130.12 105.64,130.12
  pour Bottom (no thermals): 110.64,92.12 108.64,94.12 108.64,110.62 111.14,113.12 111.14,123.62 105.14,129.62 98.64,129.62 98.14,130.12 97.64,130.12 89.14,130.12 89.14,141.62 72.14,141.62 72.14,140.62 88.14,140.62 88.14,129.12 97.89,129.12 98.39,128.62 104.14,128.62 110.14,122.62 110.14,114.12 107.64,111.62 107.64,40.62 140.64,40.62 140.64,41.62 131.14,41.62 129.14,43.62 124.14,43.62 124.14,45.62 119.64,50.12 119.64,64.62 126.64,71.62 126.64,76.12 128.14,77.62 128.14,93.12 125.14,96.12 125.14,98.12 124.14,99.12 124.14,103.62 127.14,106.62 127.14,116.12 124.14,119.12 122.64,119.12 111.64,130.12 107.64,130.12 113.64,124.12 113.64,112.62 111.14,110.12 111.14,99.62 119.64,99.62 120.64,98.62 120.64,97.62 115.14,97.62 113.14,95.62 113.14,92.12
  pour Top (no thermals): 109.64,79.12 116.14,79.12 116.14,77.12 114.64,75.62 109.64,75.62
  pour Top: 132.14,40.62 132.14,41.62 140.64,41.62 140.64,40.62
  pour Top (no thermals): 89.14,141.62 72.14,141.62 72.14,140.62 88.14,140.62 88.14,129.12 97.89,129.12 98.39,128.62 104.14,128.62 110.14,122.62 110.14,114.12 107.64,111.62 107.64,40.62 131.14,40.62 131.14,41.62 108.64,41.62 108.64,110.62 111.14,113.12 111.14,123.62 105.14,129.62 98.64,129.62 98.17,130.09 89.14,130.12
HOLE1  (via drill 3.8 pad 7.2)
  other vias: 13.64,129.56
HOLE2  (via drill 3.8 pad 7.2)
  other vias: 127.64,129.56
HOLE3  (via drill 3.8 pad 7.2)
  other vias: 22.14,73.56
HOLE4  (via drill 3.8 pad 7.2)
  other vias: 119.14,73.56
HV_AC
  pour Top (no thermals): 29.64,110.12 32.39,110.12 32.39,113.62 34.89,116.12 38.14,116.12 38.14,119.62 35.14,119.62 29.64,114.12
HV_IND_HIGH  (via drill 0.35)
  Top 0.15: v122.14,133.62 122.14,136.12 112.64,145.62 103.89,145.62 D8.C | v136.14,95.12 137.64,93.62 U4.33
  Bottom 0.15: v122.14,133.62 122.14,128.62 126.14,124.62 132.64,124.62 139.84,117.42 139.84,117.3 140.17,116.97 140.17,99.76 139.84,99.44 139.84,98.82 v136.14,95.12
HV_IND_LOW  (via drill 0.35)
  Top 0.15: D5.C 101.89,144.62 112.64,144.62 120.14,137.12 v120.14,131.62 | v136.14,97.12 138.34,94.92 U4.35
  Bottom 0.15: v120.14,131.62 120.14,129.62 126.14,123.62 132.64,123.62 139.19,117.07 139.19,117.03 139.52,116.7 139.52,100.03 139.14,99.66 139.14,99.62 136.64,97.12 v136.14,97.12
HV_IND_MAX  (via drill 0.35)
  Top 0.15: D10.C 112.39,146.37 123.14,135.62 v123.14,134.62 | U4.32 136.64,92.64 136.64,93.62 v136.14,94.12
  Bottom 0.15: v123.14,134.62 123.14,128.12 126.14,125.12 132.64,125.12 140.17,117.59 140.17,117.43 140.49,117.11 140.49,99.63 140.17,99.3 140.17,98.14 v136.14,94.12
HV_IND_MID  (via drill 0.35)
  Top 0.15: D7.C 102.89,145.12 112.64,145.12 121.14,136.62 v121.14,132.62 | v136.14,96.12 138.14,94.12 | 138.14,94.12 | 138.14,94.12 U4.34
  Bottom 0.15: v121.14,132.62 121.14,129.12 126.14,124.12 132.64,124.12 139.19,117.57 139.19,117.53 139.52,117.2 139.52,117.16 139.84,116.84 139.84,99.9 139.52,99.57 139.52,99.53 139.19,99.21 139.19,99.17 v136.14,96.12
HV_IND_MIN  (via drill 0.35)
  Top 0.15: D3.C 100.89,144.12 112.64,144.12 119.14,137.62 v119.14,130.62 | v136.14,98.12 138.54,95.72 U4.36
  Bottom 0.15: v119.14,130.62 119.14,130.12 126.14,123.12 132.64,123.12 139.19,116.57 139.19,105.39 139.14,105.34 139.14,100.12 137.14,98.12 v136.14,98.12
HVGATE  (via drill 0.35)
  Top 0.2: Q2.1 15.99,54.62 v19.64,54.62 | U3.15 26.62,60.54 26.62,61.03 26.64,61.06 v26.64,61.62
  Bottom 0.2: v19.64,54.62 23.14,54.62 26.64,58.12 v26.64,61.62
KICK  (via drill 0.35)
  Top 0.2: U5.4 99.09,135.62 v101.14,135.62 | v129.64,94.12 U4.23
  Bottom 0.2: v101.14,135.62 102.14,135.62 | 102.14,135.62 114.14,135.62 115.18,134.58 115.18,134.11 115.56,133.74 115.56,129.71 124.14,121.12 128.17,121.12 130.14,119.15 130.14,104.12 131.14,103.12 131.14,94.12 v129.64,94.12 | R40.2 102.14,135.62
KICK_GATE  (via drill 0.35)
  Top 0.61: U5.5 93.89,135.62 v96.14,135.62 | R43.2 v94.14,144.62
  Bottom 0.61: 96.14,140.62 v96.14,135.62 | 96.14,140.62 R45.1 | 96.14,140.62 96.14,141.62 94.14,143.62 v94.14,144.62
KICKER
  pour Top (no thermals): 96.14,117.12 94.14,119.12 92.14,119.12 91.14,120.12 91.14,121.62 91.14,123.12 91.64,123.62 94.14,123.62 97.14,120.62 101.64,120.62 102.14,120.12 102.14,117.62 101.64,117.12
MCU_ERR
  Top 0.2: U4.15 125.54,99.72 125.14,100.12 125.14,105.37 D14.C
MCU_INIT_OK
  Top 0.2: U4.12 127.96,102.49 127.57,102.88 127.57,104.07 129.86,106.37 D13.C
MCU_MODE
  Top 0.2: U4.14 126.24,100.52 125.64,101.12 125.64,103.12 128.14,105.62 D20.C
MISO  (via drill 0.35)
  Top 0.15: v137.14,105.62 136.84,105.32 U4.2 | v136.14,115.12 J2.8
  Bottom 0.15: v136.14,115.12 137.14,114.12 137.14,111.9 136.59,111.35 136.59,110.89 136.82,110.67 136.82,110.21 137.04,109.98 137.04,106.3 137.14,106.2 v137.14,105.62
MODE_SELECT  (via drill 0.35)
  Top 0.2: R51.2 127.64,118.77 v127.64,117.87 | v126.14,96.62 126.24,96.52 U4.19
  Bottom 0.2: v127.64,117.87 128.14,117.37 128.14,104.65 128.13,104.63 127.19,103.69 126.9,103.69 126.14,102.93 v126.14,96.62
MOSI  (via drill 0.35)
  Top 0.15: U4.1 137.64,105.12 v137.69,105.07 | v137.14,111.12 137.14,113.62 136.64,114.12 J2.7
  Bottom 0.15: v137.69,105.07 137.69,105.39 137.69,106.11 137.37,106.44 137.37,110.12 137.14,110.34 137.14,110.8 v137.14,111.12
N$1  (via drill 0.35)
  Top 0.2: R14.1 v30.64,60.62 | v28.64,62.62 26.14,62.62 25.89,62.37 25.89,60.47 U3.16
  Bottom 0.2: v30.64,60.62 v28.64,62.62
N$2
  Bottom 0.2: R36.1 R37.2
N$3
  Top 0.2: R33.1 125.14,108.87 D14.A
N$4
  Top 0.2: R32.1 D13.A
N$5
  Top 0.2: D6.A R24.1
N$6
  Top 0.2: R49.2 103.14,141.62 J5.2 | J5.2
N$7
  Bottom 0.406: C23.1 69.99,140.47 69.64,140.12 64.14,140.12 62.14,138.12 62.14,130.93 U$7.G_BOT
  Bottom 0.61: R44.2 D16.2 69.99,142.33 | 69.99,142.33 C23.1 | 69.99,142.33
N$8  (via drill 0.35)
  Top 0.406: v87.14,129.62 87.14,126.62 89.64,124.12 89.64,119.51 U$6.G_BOT
  Top 0.61: D17.2 v89.64,143.62
  Bottom 0.406: 90.14,142.12 71.64,142.12 71.14,141.62 71.14,140.62 71.64,140.12 76.14,140.12 86.64,129.62 v87.14,129.62
  Bottom 0.61: v89.64,143.62 89.64,143.12 | 89.64,143.12 90.14,143.12 | 90.14,143.12 C24.1 | 90.14,143.12 90.14,142.12 90.14,140.62 R45.2 | 89.64,143.12
N$9
  pour Top (no thermals): 46.64,148.12 47.64,149.12 59.64,149.12 59.64,142.12 47.64,142.12 46.64,143.12
N$10  (via drill 0.35)
  Top 0.2: R34.1 63.14,138.12 | 63.14,138.12 63.29,138.12 R35.2 | v63.14,136.62 63.14,138.12
  Bottom 0.2: Q6.1 64.39,136.62 v63.14,136.62
N$11  (via drill 0.35)
  Top 0.2: D3.A 98.64,148.62 99.14,149.12 v99.64,149.12
  Bottom 0.2: R21.1 v99.64,149.12
N$12  (via drill 0.35)
  Top 0.2: D5.A 101.39,149.12 v101.64,149.12
  Bottom 0.2: v101.64,149.12 102.14,148.62 R23.1
N$13  (via drill 0.35)
  Top 0.15: D7.A 102.89,149.12 v103.14,149.12
  Bottom 0.15: v103.14,149.12 103.49,149.12 R25.1
N$14
  Top 0.15: R51.1 131.83,121.22 S1.3
N$15
  Top 0.2: R46.1 R47.2
N$16
  Top 0.2: 67.54,142.17 U2.4 65.94,142.17 | 67.54,142.17 R1.1 | R2.2 67.99,141.72 67.54,142.17
N$17
  Top 0.2: R55.1 127.64,108.37 D20.A
N$19
  Top 0.2: J5.1 104.64,136.12 Q10.3
N$20
  Top 0.2: R22.1 D4.A
N$21  (via drill 0.35)
  Top 0.15: D8.A 104.39,149.12 v107.14,149.12
  Bottom 0.15: v107.14,149.12 R27.1
N$22
  Top 0.2: D2.A R20.1
N$24
  Top 0.2: R13.1 21.14,51.62 23.22,53.69 U3.1
N$26
  Top 0.2: Q5.1 88.19,146.67 88.79,147.27 R26.1 93.69,148.82 Q4.3
N$27
  Top 0.2: R28.1 D9.A
N$28
  Top 0.2: D9.C 81.39,147.62 87.61,147.62 88.47,148.47 88.8,148.47 Q5.3
N$29
  Top 0.2: R30.1 85.89,135.82 D11.A
N$30  (via drill 0.35)
  Top 0.15: D10.A 108.39,147.87 v109.64,149.12
  Bottom 0.15: v109.64,149.12 R29.1
N$32
  Top 0.813: R19.1 31.04,71.67 C19.1
N$37
  Top 0.2: Q3.3 71.84,149.12 79.64,149.12 79.89,148.87 D6.C
N$39
  pour Top (no thermals): 0.64,116.62 1.14,116.12 8.64,116.12 11.14,118.62 18.64,118.62 24.64,124.62 24.64,131.62 35.14,142.12 35.64,142.12 36.64,143.12 36.64,148.12 35.64,149.12 31.64,149.12 17.64,135.12 17.64,127.62 15.64,125.62 7.14,125.62 0.64,119.12
N$40
  Top 0.2: D12.A 120.97,128.15 R31.1
OVLO1
  Top 0.2: R10.2 26.14,51.62 24.52,53.24 U3.3
OVLO2
  Top 0.2: U3.5 25.82,53.94 28.64,51.12 30.14,51.12 31.14,50.12 R12.2
QUICK_DISCHARGE
  Bottom 0.2: R37.1 67.69,134.37 Q7.1 | Q6.3 68.64,137.62
  pour Bottom (no thermals): 68.64,139.12 70.64,139.12 70.89,138.87 70.89,133.12 70.64,132.87 68.64,132.87 68.39,133.12 68.39,138.87
RDCM
  Top 0.2: R15.2 23.22,63.09 U3.20
RVOUT
  Top 0.2: U3.18 24.52,63.04 R16.2
SCK  (via drill 0.35)
  Top 0.15: U4.3 136.14,103.9 v136.14,105.62 | v136.14,113.12 J2.6
  Bottom 0.15: v136.14,105.62 v136.14,113.12
SENSE
  Top 0.2: U3.12 28.42,61.14 28.89,61.62 30.64,61.62 32.42,59.84 32.39,59.82 32.39,43.37 31.64,42.62 18.14,42.62 arc90 18.18,42.66 Q2.3
  pour Top (no thermals): 16.64,53.62 16.64,49.12 12.64,49.12 12.64,42.62 19.64,42.62 19.64,53.62
  pour Top (no thermals): 9.14,54.62 8.64,55.12 1.14,55.12 0.64,54.62 0.64,43.12 1.14,42.62 13.14,42.62 13.14,49.12 10.14,49.12 9.64,49.12 9.14,49.62
UVLO1
  Top 0.2: R9.2 23.87,50.29 U3.2
UVLO2
  Top 0.2: U3.4 25.17,53.54 R11.2
V+  (via drill 0.35)
  Top 0.2: C8.+ 131.64,43.07 131.64,46.57 R46.2 | R30.2 85.64,112.12
  Bottom 0.2: R38.1 65.89,123.68 R36.2
  other vias: 71.64,114.62 72.14,113.87 72.64,114.62 73.39,113.87 74.14,114.62 74.64,113.87 75.14,114.62
  pour Top (no thermals): 7.14,38.12 8.64,39.62 40.14,39.62 40.14,34.12 35.64,30.12 35.64,11.62 34.14,10.12 31.14,10.12 8.64,34.12 7.14,35.12
  pour Top (no thermals): 50.64,114.62 37.14,114.62 34.64,112.12 34.64,39.62 40.14,39.62 40.14,106.62 40.64,107.12 100.64,107.12 101.14,106.62 101.14,26.12 105.64,22.12 105.64,11.12 106.64,10.12 110.14,10.12 134.14,35.12 134.14,38.12 132.64,39.62 106.64,39.62 106.64,112.62 106.64,114.62 106.14,115.12 100.64,115.12 99.64,116.12 99.14,116.12 96.14,116.12 95.64,115.62 95.64,112.62 85.64,112.62 77.64,112.62 76.14,112.62 75.64,113.12 75.64,114.62 75.14,115.12 71.64,115.12 71.14,114.62 71.14,113.12 70.64,112.62 56.14,112.62 55.64,113.12 55.64,115.62 55.14,116.12 52.14,116.12
  pour Top (no thermals): 7.14,38.12 8.64,39.62 40.14,39.62 40.14,26.62 35.64,22.12 35.64,11.62 34.14,10.12 31.14,10.12 8.64,33.62 7.14,35.12
  pour Bottom (no thermals): 70.64,116.62 71.14,117.12 75.64,117.12 76.14,116.62 76.14,114.12 75.39,113.37 71.39,113.37 70.64,114.12
VBATT  (via drill 0.35)
  Top 0.2: U3.14 U3.13 27.77,61.49 v27.64,61.62 | R12.1 R11.1 R10.1 R9.1 R13.2 21.14,48.28 20.12,49.3 20.12,52.09 22.14,54.12 v22.14,61.62 | v30.14,135.62 31.15,136.63 C18.2
  Top 0.61: v74.64,147.12 73.64,146.12 67.96,146.12 67.46,146.62 67.46,148.62 64.64,148.62 64.14,148.12 64.14,144.12 | C5.1 62.64,145.62 62.91,145.35 U2.1 64.09,144.07 64.14,144.12 | 60.14,139.62 61.14,140.62 61.14,142.12 62.86,142.12 U2.3 62.96,142.12 64.14,142.12 64.14,144.12
  Bottom 0.2: v27.64,61.62 27.46,61.62 26.88,62.19 26.4,62.19 25.83,61.62 v22.14,61.62 11.64,61.62 2.14,71.12 2.14,117.12 9.14,124.12 17.14,124.12 28.64,135.62 v30.14,135.62 | R8.2 R3.2 R5.2 97.39,142.37 97.14,142.62
  Bottom 0.61: v74.64,147.12 75.39,147.87 92.64,147.87 97.14,143.37 97.14,142.62 97.14,132.62 99.14,130.62 105.14,130.62 112.14,123.62 112.14,113.12 109.64,110.62 109.64,95.66 U1.1
  pour Top (no thermals): 9.64,110.12 9.64,116.12 11.64,118.12 19.14,118.12 28.14,127.12 33.64,127.12 39.14,132.62 50.14,132.62 57.64,140.12 60.14,140.12 60.64,139.62 60.64,136.62 50.14,126.12 47.64,126.12 40.64,126.12 36.14,121.62 32.14,121.62 24.64,114.12 24.64,110.12
  pour Top (no thermals): 22.14,49.12 22.14,43.62 20.14,43.62 20.14,49.12
  pour Top (no thermals): 30.14,43.62 31.89,43.62 31.89,48.87 30.14,48.87
  pour Top (no thermals): 32.64,138.12 38.64,132.12 37.64,131.12 31.64,137.12
  pour Top (no thermals): 109.64,102.12 116.14,102.12 116.14,100.12 116.14,99.62 112.64,96.12 112.64,92.62 110.64,92.62 110.64,96.12 109.64,97.12 109.64,97.62
VMON  (via drill 0.35)
  Top 0.2: R48.2 R47.1 125.14,46.57 v125.14,44.62 | v140.14,93.12 139.64,93.12 138.39,91.87 138.39,91.37 138.14,91.12 136.04,91.12 U4.31
  Bottom 0.2: v125.14,44.62 140.64,60.12 140.64,92.62 v140.14,93.12
VSN
  Top 0.2: R16.1 R15.1 arc-90 22.14,66.07 22.14,67.62 21.64,68.12 20.14,68.12 20.14,67.66 Q2.2
  Top 0.813: R19.2 28.14,73.82 28.14,75.12 23.14,80.12 L1.10
  pour Top (no thermals): 10.14,58.62 10.14,83.12 24.14,83.12 24.14,79.12 22.64,77.62 21.64,77.62 20.64,77.62 18.14,75.62 18.14,71.62 21.14,68.62 21.14,58.62

## Text on the board
tPlace: CHG LEVEL | CHARGE | FAULT | 30/50A | LT3751 | > | AUTO DSCHG | BALL | MISO | MOSI | SCK | !CS! | DBG | !RESET | GND | + | NC | HV AC | J2 PINOUT | NC | HIGH VOLTAGE | MCU STATUS | ID | Kicker v3.0 | 15V | PWR | HIGH VOLTAGE | 5V | CHIP | KICK | HIGH VOLTAGE | CHARGE | RoboJackets 2018 | HIGH VOLTAGE | HIGH VOLTAGE | - | -
bPlace: >
tDocu: x
bDocu: -